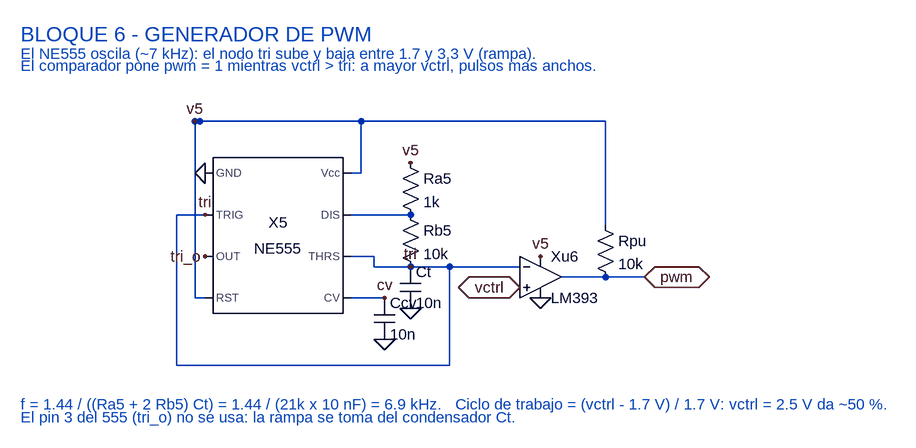
[diagram p0: schematic BLOQUE_PWM_GEN.asc]
BLOQUE_PWM_GEN.asc, the LTspice schematic file:
Version 4
SHEET 1 1200 700
WIRE 408 128 500 128
WIRE 408 192 444 192
WIRE 444 192 444 208
WIRE 444 208 500 208
WIRE 408 256 460 256
WIRE 500 208 560 208
WIRE 560 208 668 208
WIRE 184 128 140 128
WIRE 140 128 140 360
WIRE 140 360 560 360
WIRE 560 360 560 208
WIRE 732 224 800 224
WIRE 800 224 860 224
WIRE 168 -16 800 -16
WIRE 168 -16 176 -16
WIRE 408 64 424 64
WIRE 424 64 424 -16
WIRE 800 144 800 -16
WIRE 184 256 168 256
WIRE 168 256 168 -16
FLAG 184 64 0
FLAG 184 128 tri
FLAG 184 192 tri_o
FLAG 500 48 v5
FLAG 500 272 0
FLAG 500 208 tri
FLAG 460 320 0
FLAG 460 256 cv
FLAG 668 240 vctrl
FLAG 700 192 v5
FLAG 700 256 0
FLAG 860 224 pwm
FLAG 168 -16 v5
IOPIN 668 240 BiDir
IOPIN 860 224 BiDir
SYMBOL Misc\NE555 296 160 R0
SYMATTR InstName X5
SYMATTR Value NE555
SYMBOL res 484 32 R0
SYMATTR InstName Ra5
SYMATTR Value 1k
SYMBOL res 484 112 R0
SYMATTR InstName Rb5
SYMATTR Value 10k
SYMBOL cap 484 208 R0
SYMATTR InstName Ct
SYMATTR Value 10n
SYMBOL cap 444 256 R0
SYMATTR InstName Ccv
SYMATTR Value 10n
SYMBOL OpAmps\opamp2 700 160 R0
SYMATTR InstName Xu6
SYMATTR Value LM393
SYMBOL res 784 128 R0
SYMATTR InstName Rpu
SYMATTR Value 10k
TEXT -100 -150 Left 3 ;BLOQUE 6 - GENERADOR DE PWM
TEXT -100 -120 Left 2 ;El NE555 oscila (~7 kHz): el nodo tri sube y baja entre 1.7 y 3.3 V (rampa).
TEXT -100 -102 Left 2 ;El comparador pone pwm = 1 mientras vctrl > tri: a mayor vctrl, pulsos mas anchos.
TEXT -100 420 Left 2 ;f = 1.44 / ((Ra5 + 2 Rb5) Ct) = 1.44 / (21k x 10 nF) = 6.9 kHz.   Ciclo de trabajo = (vctrl - 1.7 V) / 1.7 V: vctrl = 2.5 V da ~50 %.
TEXT -100 440 Left 2 ;El pin 3 del 555 (tri_o) no se usa: la rampa se toma del condensador Ct.

The netlist it stands for:
* BLOQUE_PWM_GEN.asc
XX5 0 tri tri_o v5 cv tri N001 v5 NE555  ; pins GND TRIG OUT RST CV THRS DIS Vcc
Ra5 v5 N001 1k
Rb5 N001 tri 10k
Ct tri 0 10n
Ccv cv 0 10n
XXu6 vctrl tri v5 0 pwm LM393  ; pins In+ In- V+ V- OUT
Rpu v5 pwm 10k
* BLOQUE 6 - GENERADOR DE PWM
* El NE555 oscila (~7 kHz): el nodo tri sube y baja entre 1.7 y 3.3 V (rampa).
* El comparador pone pwm = 1 mientras vctrl > tri: a mayor vctrl, pulsos mas anchos.
* f = 1.44 / ((Ra5 + 2 Rb5) Ct) = 1.44 / (21k x 10 nF) = 6.9 kHz.   Ciclo de trabajo = (vctrl - 1.7 V) / 1.7 V: vctrl = 2.5 V da ~50 %.
* El pin 3 del 555 (tri_o) no se usa: la rampa se toma del condensador Ct.
.lib NE555.sub
.backanno
.end